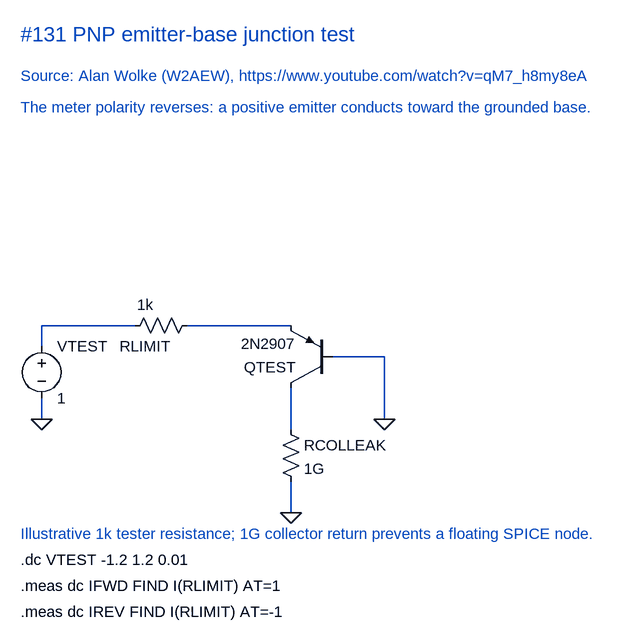
[diagram p0: schematic PNP junction test.asc]
PNP junction test.asc, the LTspice schematic file:
Version 4.1
SHEET 1 1040 1040
WIRE 240 480 96 480
WIRE 336 480 320 480
WIRE 480 480 336 480
WIRE 96 512 96 480
WIRE 624 528 544 528
WIRE 96 624 96 592
WIRE 624 624 624 528
WIRE 480 640 480 576
WIRE 480 768 480 720
FLAG 96 624 0
FLAG 624 624 0
FLAG 480 768 0
SYMBOL voltage 96 496 R0
SYMATTR InstName VTEST
SYMATTR Value 1
SYMBOL res 224 496 R270
WINDOW 0 0 32 VBottom 2
WINDOW 3 32 32 VTop 2
SYMATTR InstName RLIMIT
SYMATTR Value 1k
SYMBOL pnp 544 576 R180
SYMATTR InstName QTEST
SYMATTR Value 2N2907
SYMBOL res 464 624 R0
SYMATTR InstName RCOLLEAK
SYMATTR Value 1G
TEXT 64 32 Left 3 ;#131 PNP emitter-base junction test
TEXT 64 96 Left 2 ;Source: Alan Wolke (W2AEW), https://www.youtube.com/watch?v=qM7_h8my8eA
TEXT 64 144 Left 2 ;The meter polarity reverses: a positive emitter conducts toward the grounded base.
TEXT 64 840 Left 2 !.dc VTEST -1.2 1.2 0.01
TEXT 64 880 Left 2 !.meas dc IFWD FIND I(RLIMIT) AT=1
TEXT 64 920 Left 2 !.meas dc IREV FIND I(RLIMIT) AT=-1
TEXT 64 800 Left 2 ;Illustrative 1k tester resistance; 1G collector return prevents a floating SPICE node.

The netlist it stands for:
* PNP junction test.asc
VTEST N001 0 1
RLIMIT N001 N002 1k
QTEST N003 0 N002 0 2N2907
RCOLLEAK N003 0 1G
.model NPN NPN
.model PNP PNP
.lib standard.bjt
* #131 PNP emitter-base junction test
* Source: Alan Wolke (W2AEW), https://www.youtube.com/watch?v=qM7_h8my8eA
* The meter polarity reverses: a positive emitter conducts toward the grounded base.
.dc VTEST -1.2 1.2 0.01
.meas dc IFWD FIND I(RLIMIT) AT=1
.meas dc IREV FIND I(RLIMIT) AT=-1
* Illustrative 1k tester resistance; 1G collector return prevents a floating SPICE node.
.backanno
.end